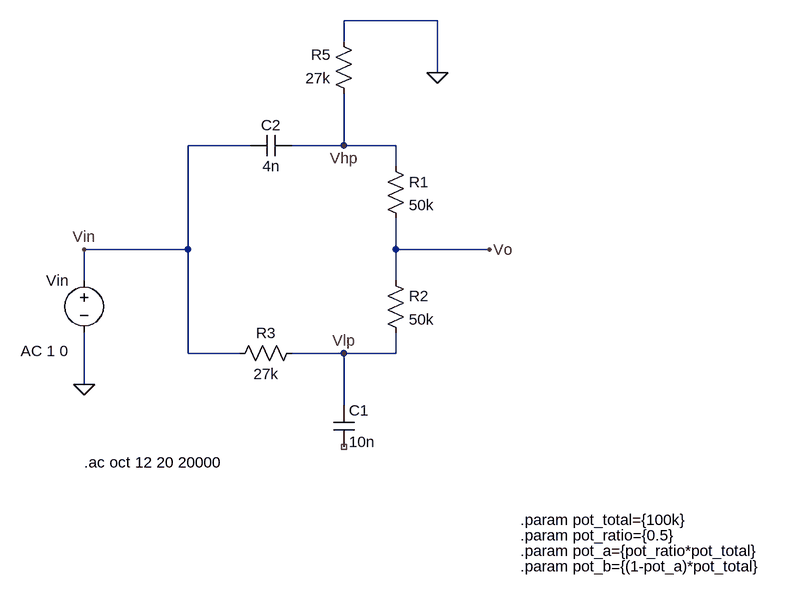
[diagram p0: schematic tone_control_big_muff.asc]
tone_control_big_muff.asc, the LTspice schematic file:
Version 4
SHEET 1 880 688
WIRE -208 -192 -352 -192
WIRE -352 -160 -352 -192
WIRE -208 -112 -208 -192
WIRE -496 0 -592 0
WIRE -352 0 -352 -80
WIRE -352 0 -432 0
WIRE -272 0 -352 0
WIRE -272 32 -272 0
WIRE -592 160 -592 0
WIRE -592 160 -752 160
WIRE -272 160 -272 112
WIRE -128 160 -272 160
WIRE -752 208 -752 160
WIRE -272 208 -272 160
WIRE -592 320 -592 160
WIRE -512 320 -592 320
WIRE -352 320 -432 320
WIRE -272 320 -272 288
WIRE -272 320 -352 320
WIRE -752 368 -752 288
WIRE -352 400 -352 320
FLAG -752 368 0
FLAG -352 320 Vlp
FLAG -352 0 Vhp
FLAG -752 160 Vin
FLAG -128 160 Vo
FLAG -208 -112 0
SYMBOL res -288 16 R0
SYMATTR InstName R1
SYMATTR Value 50k
SYMBOL res -288 192 R0
SYMATTR InstName R2
SYMATTR Value 50k
SYMBOL res -416 304 R90
WINDOW 0 0 56 VBottom 2
WINDOW 3 32 56 VTop 2
SYMATTR InstName R3
SYMATTR Value 27k
SYMBOL cap -368 400 R0
SYMATTR InstName C1
SYMATTR Value 10n
SYMBOL res -336 -64 R180
WINDOW 0 36 76 Left 2
WINDOW 3 36 40 Left 2
SYMATTR InstName R5
SYMATTR Value 27k
SYMBOL cap -432 -16 R90
WINDOW 0 0 32 VBottom 2
WINDOW 3 32 32 VTop 2
SYMATTR InstName C2
SYMATTR Value 4n
SYMBOL voltage -752 192 M0
WINDOW 123 24 124 Left 2
WINDOW 39 0 0 Left 0
WINDOW 3 24 44 Left 2
SYMATTR Value2 AC 1 0
SYMATTR Value ""
SYMATTR InstName Vin
TEXT -80 576 Left 2 !.param pot_total={100k}
TEXT -80 600 Left 2 !.param pot_ratio={0.5}
TEXT -80 624 Left 2 !.param pot_a={pot_ratio*pot_total}
TEXT -80 648 Left 2 !.param pot_b={(1-pot_a)*pot_total}
TEXT -752 488 Left 2 !.ac oct 12 20 20000

The netlist it stands for:
* tone_control_big_muff.asc
R1 Vhp Vo 50k
R2 Vo Vlp 50k
R3 Vlp Vin 27k
C1 Vlp NC_01 10n
R5 Vhp 0 27k
C2 Vhp Vin 4n
Vin Vin 0 AC 1 0
.param pot_total={100k}
.param pot_ratio={0.5}
.param pot_a={pot_ratio*pot_total}
.param pot_b={(1-pot_a)*pot_total}
.ac oct 12 20 20000
.backanno
.end